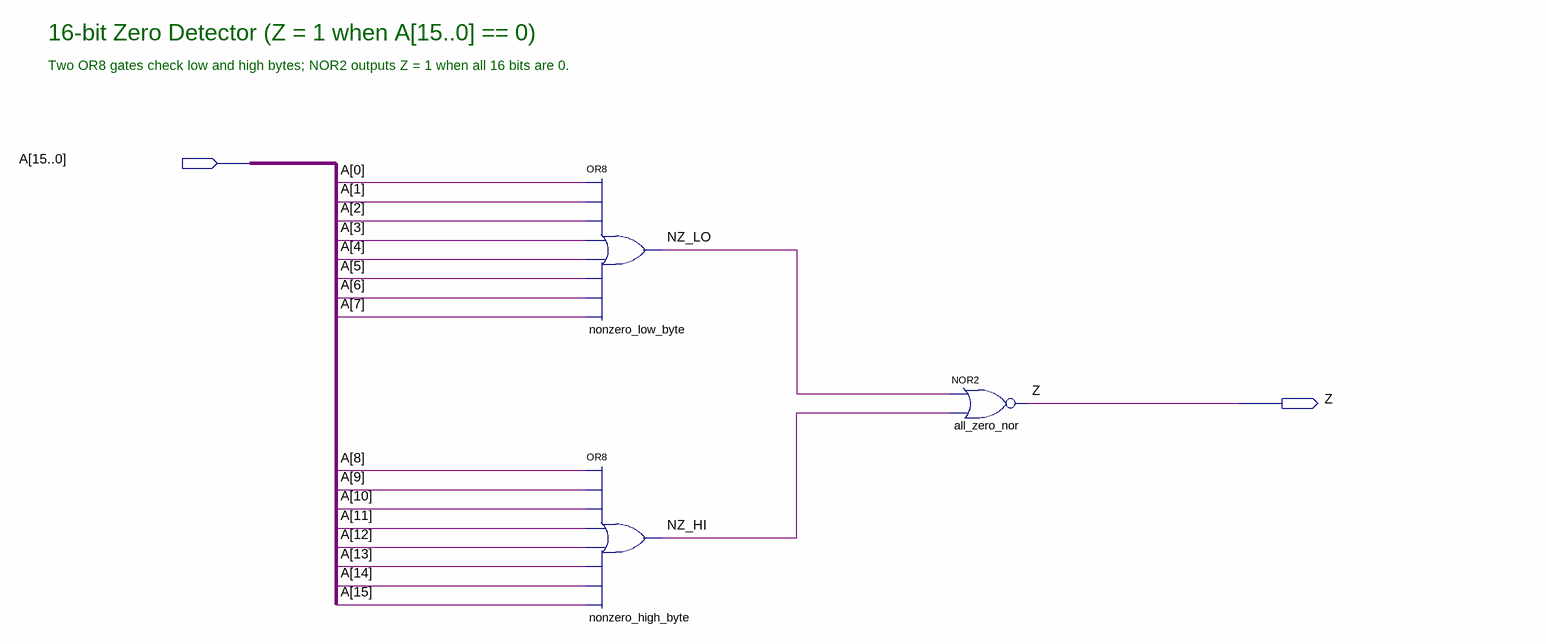
[diagram p0: schematic sheet]
// Quartus schematic zero_detect16.bdf as structural Verilog: 3 symbols, 2 pins
module zero_detect16 (
  input  [15:0] A,
  output Z
);

  wire NZ_HI, NZ_LO;

  or nonzero_low_byte (NZ_LO, A[0], A[1], A[2], A[3], A[4], A[5], A[6], A[7]);
  or nonzero_high_byte (NZ_HI, A[8], A[9], A[10], A[11], A[12], A[13], A[14], A[15]);
  nor all_zero_nor (Z, NZ_LO, NZ_HI);

  // Notes on the sheet:
  //   16-bit Zero Detector (Z = 1 when A[15..0] == 0)
  //   Two OR8 gates check low and high bytes; NOR2 outputs Z = 1 when all 16 bits are 0.
endmodule
